# Altium project RC_Wheelchair.PrjPCB (part 2 of 4)

## Sheet Connector_Section.SchDoc
size A; DocumentNumber: 6; SheetNumber: 6; SheetTotal: 8
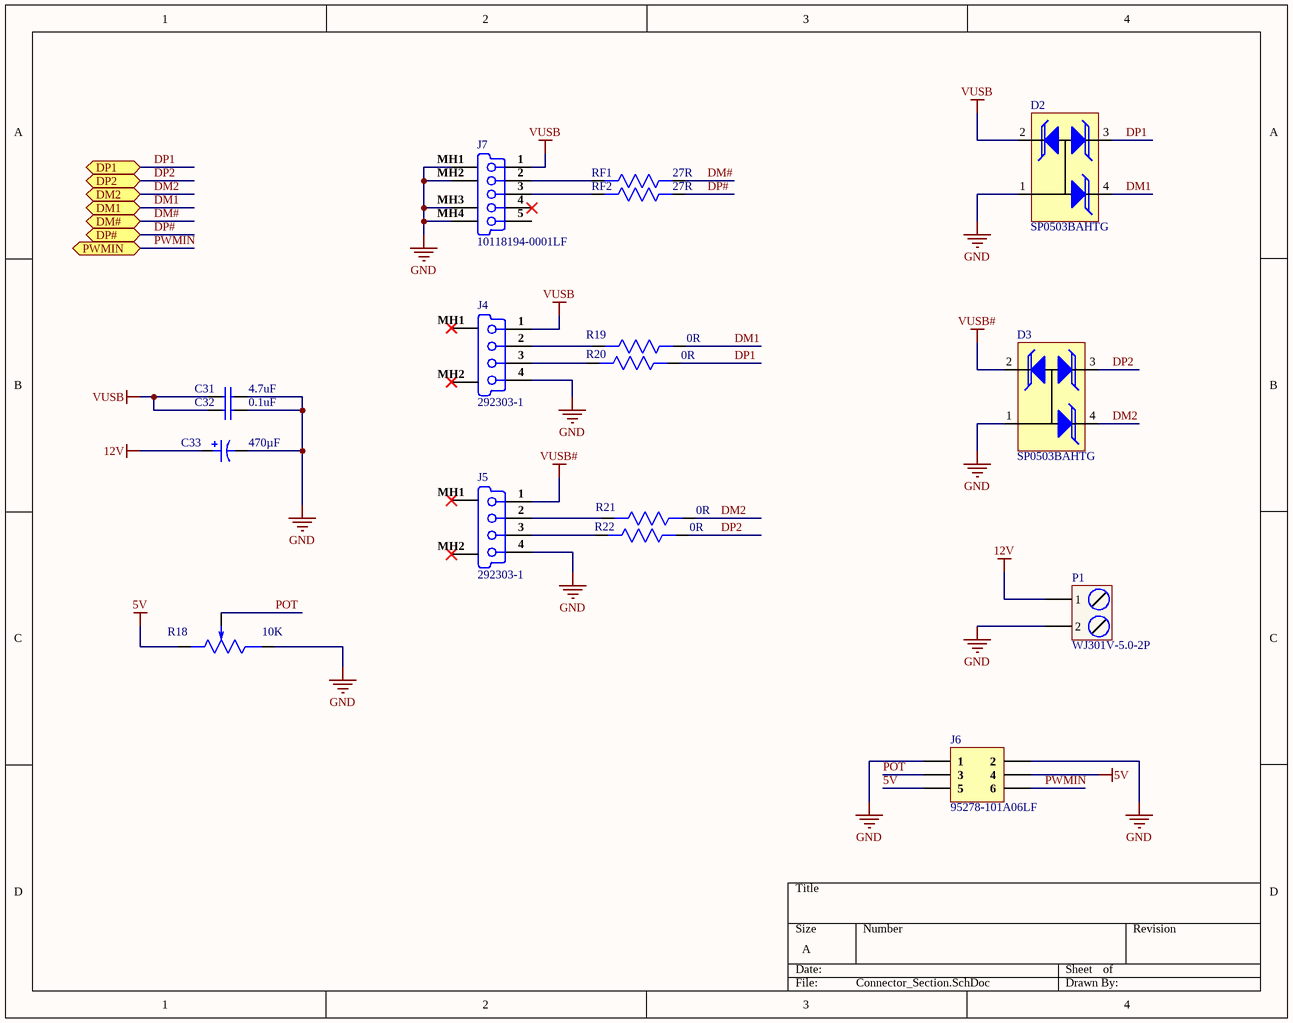
[diagram p3: Connector_Section.SchDoc]

### Parts
C31  4.7uF  [CAP 0603]
C32  0.1uF  [CAP 0402]
C33  470µF  [UCD1V471MNL6GS]
D2  SP0503BAHTG  [SOT-143]
D3  SP0503BAHTG  [SOT-143]
J4  292303-1  [292303-1]
J5  292303-1  [292303-1]
J6  95278-101A06LF  [95278-101A06LF]
J7  10118194-0001LF  [10118194-0001LF]
P1  WJ301V-5.0-2P  [WJ301V-5.0-2P]
R18  10K  [RK14J11R000J]
R19  0R  [Res0402]
R20  0R  [Res0402]
R21  0R  [Res0402]
R22  0R  [Res0402]
RF1  27R  [Res0402]
RF2  27R  [Res0402]

### Ports
DM1 (bidir), DM2 (bidir), DM# (bidir), DP1 (bidir), DP2 (bidir), DP# (bidir), PWMIN (bidir)

### Nets
5V: J6.4 J6.5 R18.1(ccw)
12V: C33.1 P1.1
GND: C31.2 C32.2 C33.2 D2.1(K) D3.1(K) J4.4(NC) J5.4(NC) J6.1 J6.2 J7.MH1(Tab) J7.MH2(Tab) J7.MH3(Tab) J7.MH4(Tab) P1.2 R18.3(cw)
VUSB: C31.1 C32.1 D2.2(A) J4.1(V_BUS_(5V)) J7.1(V_BUS_(5V))
VUSB#: D3.2(A) J5.1(V_BUS_(5V))
DM1: D2.4(A) R19.1 ; port DM1
DM2: D3.4(A) R21.1 ; port DM2
DM#: RF1.1 ; port DM#
DP1: D2.3(A) R20.1 ; port DP1
DP2: D3.3(A) R22.1 ; port DP2
DP#: RF2.1 ; port DP#
POT: J6.3 R18.2(wiper)
PWMIN: J6.6 ; port PWMIN
NetJ4_2: J4.2(D-) R19.2
NetJ4_3: J4.3(D+) R20.2
NetJ5_2: J5.2(D-) R21.2
NetJ5_3: J5.3(D+) R22.2
NetJ7_2: J7.2(D-) RF1.2
NetJ7_3: J7.3(D+) RF2.2

Not connected (* = marked no-connect by the designer): J4 MH1(Tab)* MH2(Tab)*; J5 MH1(Tab)* MH2(Tab)*; J7 4(NC)* 5(GND); R18 D1(cw) D2(cw) MH1(cw) MH2(cw) MP1(cw) MP2(cw)

### Library data of the parts
C31 = CC0603KRX5R7BB475: CAP CER 4.7UF 16V X5R 0603; Manufacturer: Yageo; Tolerance: 10%; Supplier 1: Digi-Key; Manufacturer Part Number: CC0603KRX5R7BB475; Stock 1: 1214; Pricing 1: 1=0.53, 10=0.371, 100=0.2446 (USD); Mount: Surface Mount; Case/Package: 0603; Weight: 7.1E-05oz; Case Code (Imperial): 0603; Case Code (Metric): 1608; Min Operating Temperature: -55°C; Max Operating Temperature: 85°C; Capacitance: 4.7uF; Voltage Rating: 16V; Voltage Rating (DC): 16V; Packaging: Tape and Reel; Dielectric: X5R; Termination: SMD/SMT; Composition: Ceramic; Length: 1.6mm; Height: 0.8mm; Width: 0.8mm; Thickness: 0.037inch; Depth: 0.8mm; Lead Free: Lead Free; Halogen Free: Halogen Free; ComponentLink1URL: http://www.mouser.com/ds/2/447/UPY-GPHC_X5R_4V-to-50V_25-1131599.pdf?src-supplier=Mouser; ComponentLink1Description: http://www.mouser.com/ds/2/447/UPY-GPHC_X5R_4V-to-50V_25-1131599.pdf?src-supplier=Mouser; ComponentLink2URL: http://www.yageo.com/documents/recent/UPY-GPHC_X5R_4V-to-50V_25.pdf?src-supplier=Digi-Key; ComponentLink2Description: http://www.yageo.com/documents/recent/UPY-GPHC_X5R_4V-to-50V_25.pdf?src-supplier=Digi-Key; ComponentLink3URL: http://components.arrow.com/part/dataview/0323_04166500?src-supplier=Arrow+Europe; ComponentLink3Description: http://components.arrow.com/part/dataview/0323_04166500?src-supplier=Arrow+Europe; Supplier Part Number 1: 311-1785-1-ND
C32 = CC0402KRX7R7BB104: CAP CER 0.1UF 16V X7R 0402; Manufacturer: Yageo; Tolerance: 10%; Capacitance: 100nF; Supplier 1: Digi-Key; Manufacturer Part Number: CC0402KRX7R7BB104; Stock 1: 9987374; Pricing 1: 1=0.1, 10=0.034, 100=0.015, 500=0.0107, 1000=0.00841, 2500=0.00764, 5000=0.00703 (USD); Mount: Surface Mount; Case/Package: 0402; Number of Pins: 2; Case Code (Metric): 1005; Case Code (Imperial): 0402; Min Operating Temperature: -55°C; Max Operating Temperature: 125°C; Dielectric: X7R; Voltage Rating: 16V; Voltage Rating (DC): 16V; Packaging: Tape and Reel; Package Quantity: 1; Termination: SMD/SMT; Composition: Ceramic; Voltage: 16V; Length: 1mm; Height: 0.5mm; Width: 0.02inch; Thickness: 0.022inch; Depth: 0.5mm; Radiation Hardening: No; REACH SVHC: No SVHC; Lead Free: Lead Free; Halogen Free: Halogen Free; ComponentLink1URL: http://www.yageo.com/documents/recent/UPY-GPHC_X7R_6.3V-to-50V_8.pdf?src-supplier=Avnet+Europe; ComponentLink1Description: http://www.yageo.com/documents/recent/UPY-GPHC_X7R_6.3V-to-50V_8.pdf?src-supplier=Avnet+Europe; ComponentLink2URL: http://www.yageo.com/documents/recent/UPY-GPHC_X7R_6.3V-to-50V_18.pdf?src-supplier=Digi-Key; ComponentLink2Description: http://www.yageo.com/documents/recent/UPY-GPHC_X7R_6.3V-to-50V_18.pdf?src-supplier=Digi-Key; ComponentLink3URL: http://www.yageo.com/documents/recent/UPY-GPHC_X7R_6.3V-to-50V_8.pdf?src-supplier=Avnet; ComponentLink3Description: http://www.yageo.com/documents/recent/UPY-GPHC_X7R_6.3V-to-50V_8.pdf?src-supplier=Avnet; ComponentLink4URL: http://www.yageo.com/documents/recent/UPY-GPHC_X7R_6.3V-to-50V_18.pdf?src-supplier=Mouser; ComponentLink4Description: http://www.yageo.com/documents/recent/UPY-GPHC_X7R_6.3V-to-50V_18.pdf?src-supplier=Mouser; ComponentLink5URL: http://www.farnell.com/datasheets/2167236.pdf?src-supplier=Element14; ComponentLink5Description: http://www.farnell.com/datasheets/2167236.pdf?src-supplier=Element14; ComponentLink6URL: http://www.farnell.com/datasheets/1489800.pdf?src-supplier=Element14; ComponentLink6Description: http://www.farnell.com/datasheets/1489800.pdf?src-supplier=Element14; Supplier Part Number 1: 311-1338-1-ND
C33 = UCD1V471MNL6GS: 470µF 35V Aluminum Electrolytic Capacitors Radial, Can - SMD; Manufacturer: Nichicon; Capacitance: 470uF; Tolerance: 20%; Ripple Current: 950mA; Leakage Current: 3uA; Supplier 1: Digi-Key; Manufacturer Part Number: UCD1V471MNL6GS; Stock 1: 2530; Pricing 1: 1=1.04, 10=0.789, 50=0.6556, 100=0.5646 (USD); Case/Package: Aluminum; Min Operating Temperature: -55°C; Max Operating Temperature: 105°C; Voltage Rating (DC): 35V; Packaging: Tape and Reel; Package Quantity: 400; Termination: SMD/SMT; Length: 13.5mm; ComponentLink1URL: http://www.mouser.com/ds/2/293/e-ucd-883803.pdf?src-supplier=Mouser; ComponentLink1Description: http://www.mouser.com/ds/2/293/e-ucd-883803.pdf?src-supplier=Mouser; ComponentLink2URL: http://nichicon-us.com/english/products/pdfs/e-ucd.pdf?src-supplier=Digi-Key; ComponentLink2Description: http://nichicon-us.com/english/products/pdfs/e-ucd.pdf?src-supplier=Digi-Key; Supplier Part Number 1: 493-14715-6-ND
D2 D3 = SP0503BAHTG: TVS DIODE 5.5V 8.5V SOT143-4; Manufacturer: Littelfuse; Element Configuration: Common Anode; Direction: Unidirectional; Capacitance: 30pF; Number of Channels: 3; Power Line Protection: No; Polarity: Bidirectional,Unidirectional; Max Power Dissipation: 225mW; ESD Protection: Yes; Max Reverse Leakage Current: 100nA; Voltage Rating (DC): 5V; Diode Type: Avalanche; Supplier 1: Digi-Key; Manufacturer Part Number: SP0503BAHTG; Stock 1: 86047; Pricing 1: 1=0.8, 10=0.703, 25=0.6604, 100=0.4793, 250=0.4622, 500=0.40044, 1000=0.3408 (USD); Mount: Surface Mount; Case/Package: SOT-143; Number of Pins: 4; Min Operating Temperature: -40°C; Max Operating Temperature: 85°C; Operating Supply Voltage: 5.5V; Packaging: Tape and Reel; Number of Unidirectional Channels: 3; Reverse Standoff Voltage: 5.5V; Clamping Voltage: 8.5V; Breakdown Voltage: 5.5V; Termination: SMD/SMT; Working Voltage: 5.5V; Peak Pulse Power: 225mW; Leakage Current: 100nA; Number of Elements: 3; Power Dissipation: 225mW; Composition: Zener; Length: 3.04mm; Height: 1.05mm; Width: 1.4mm; Depth: 1.4mm; Radiation Hardening: No; REACH SVHC: No SVHC; Lead Free: Lead Free; ComponentLink1URL: https://www.littelfuse.com/~/media/files/littelfuse/technical%20resources/documents/data%20sheets/sp05xxba.pdf?src-supplier=Digi-Key; ComponentLink1Description: https://www.littelfuse.com/~/media/files/littelfuse/technical%20resources/documents/data%20sheets/sp05xxba.pdf?src-supplier=Digi-Key; ComponentLink2URL: http://www.farnell.com/datasheets/1911798.pdf?src-supplier=Element14; ComponentLink2Description: http://www.farnell.com/datasheets/1911798.pdf?src-supplier=Element14; ComponentLink3URL: http://www.littelfuse.com/data/en/Data_Sheets/SP05xxBA.pdf?src-supplier=Future+Electronics; ComponentLink3Description: http://www.littelfuse.com/data/en/Data_Sheets/SP05xxBA.pdf?src-supplier=Future+Electronics; ComponentLink4URL: http://www.mouser.com/ds/2/240/Littelfuse_TVS_Diode_Array_SP05_Datasheet.pdf-777043.pdf?src-supplier=Mouser; ComponentLink4Description: http://www.mouser.com/ds/2/240/Littelfuse_TVS_Diode_Array_SP05_Datasheet.pdf-777043.pdf?src-supplier=Mouser; ComponentLink5URL: http://www.farnell.com/datasheets/526672.pdf?src-supplier=Element14; ComponentLink5Description: http://www.farnell.com/datasheets/526672.pdf?src-supplier=Element14; ComponentLink6URL: https://www.verical.com/server-webapp/html/getDatasheet?partID=116020&src-supplier=Verical; ComponentLink6Description: https://www.verical.com/server-webapp/html/getDatasheet?partID=116020&src-supplier=Verical; Supplier Part Number 1: F2715CT-ND
J4 J5 = 292303-1: USB-A (USB TYPE-A) USB 2.0 Receptacle Connector 4 Position Through Hole, Right Angle; Manufacturer: TE Connectivity; Plating: Bright,Tin; Number of Positions: 4; Number of Ports: 1; Plating Thickness: 0.76um; Contact Current Rating: 1A; Circuit Application: Signal; Connector System: Cable-to-Board; USB Standard: USB 2.0; Insulation Resistance: 1GR; Voltage Rating (AC): 30V; Pitch: 2.5mm; PCB Thickness: 0.062inch; Tail Length: 0.112inch; Approvals: UL; Supplier 1: Digi-Key; Manufacturer Part Number: 292303-1; Stock 1: 19088; Pricing 1: 1=1.49, 10=1.354, 25=1.2716, 50=1.2162, 100=1.161, 250=1.0504, 500=0.96748, 1000=0.82926, 2500=0.77398 (USD); Mount: Through Hole,Horizontal; Contact Plating: Gold; Housing Material: Thermoplastic; Housing Color: Black; Contact Material: Copper Alloy,Copper; Number of Terminals: 4; Color: Black; Min Operating Temperature: -67°C; Max Operating Temperature: 185°C; Packaging: Rail/Tube; Package Quantity: 30; Termination: Through Hole; Gender: Receptacle; Connector Type: Receptacle; Orientation: Right Angle; Number of Contacts: 4; Current Rating: 1A; Length: 14.63mm; Depth: 14mm; REACH SVHC: No SVHC; Flammability Rating: UL94 V-0; Halogen Free: Halogen Free; ComponentLink1URL: http://www.farnell.com/datasheets/1699414.pdf?src-supplier=Farnell; ComponentLink1Description: http://www.farnell.com/datasheets/1699414.pdf?src-supplier=Farnell; ComponentLink2URL: http://www.te.com/commerce/DocumentDelivery/DDEController?Action=showdoc&DocId=Data+Sheet%7F1-1773453-6%7F0908%7Fpdf%7FEnglish%7FENG_DS_1-1773453-6_0908.pdf&src-supplier=Avnet; ComponentLink2Description: http://www.te.com/commerce/DocumentDelivery/DDEController?Action=showdoc&DocId=Data+Sheet%7F1-1773453-6%7F0908%7Fpdf%7FEnglish%7FENG_DS_1-1773453-6_0908.pdf&src-supplier=Avnet; ComponentLink3URL: http://www.te.com/commerce/DocumentDelivery/DDEController?Action=showdoc&DocId=Data+Sheet1-1773453-60908pdfEnglishENG_DS_1-1773453-6_0908.pdf&src-supplier=Avnet+Asia; ComponentLink3Description: http://www.te.com/commerce/DocumentDelivery/DDEController?Action=showdoc&DocId=Data+Sheet1-1773453-60908pdfEnglishENG_DS_1-1773453-6_0908.pdf&src-supplier=Avnet+Asia; ComponentLink4URL: https://www.te.com/commerce/DocumentDelivery/DDEController?Action=srchrtrv&DocNm=292303&DocType=Customer+Drawing&DocLang=English&src-supplier=Digi-Key; ComponentLink4Description: https://www.te.com/commerce/DocumentDelivery/DDEController?Action=srchrtrv&DocNm=292303&DocType=Customer+Drawing&DocLang=English&src-supplier=Digi-Key; ComponentLink5URL: http://www.farnell.com/datasheets/1699414.pdf?src-supplier=Element14; ComponentLink5Description: http://www.farnell.com/datasheets/1699414.pdf?src-supplier=Element14; ComponentLink6URL: http://www.farnell.com/cad/1699210.pdf?src-supplier=Element14; ComponentLink6Description: http://www.farnell.com/cad/1699210.pdf?src-supplier=Element14; ComponentLink7URL: https://www.alliedelec.com/m/d/b8ff6cd1157c72c7c4c41b4704d2a2e6.pdf?src-supplier=Allied+Electronics; ComponentLink7Description: https://www.alliedelec.com/m/d/b8ff6cd1157c72c7c4c41b4704d2a2e6.pdf?src-supplier=Allied+Electronics; ComponentLink8URL: http://www.te.com/commerce/DocumentDelivery/DDEController?Action=showdoc&DocId=Data+Sheet%7F1-1773453-6%7F0908%7Fpdf%7FEnglish%7FENG_DS_1-1773453-6_0908.pdf&src-supplier=Avnet+Europe; ComponentLink8Description: http://www.te.com/commerce/DocumentDelivery/DDEController?Action=showdoc&DocId=Data+Sheet%7F1-1773453-6%7F0908%7Fpdf%7FEnglish%7FENG_DS_1-1773453-6_0908.pdf&src-supplier=Avnet+Europe; ComponentLink9URL: https://www.distrelec.biz/Web/Downloads/07/08/04270708.pdf?mime=application%2Fpdf&src-supplier=Distrelec; ComponentLink9Description: https://www.distrelec.biz/Web/Downloads/07/08/04270708.pdf?mime=application%2Fpdf&src-supplier=Distrelec; ComponentLink10URL: http://www.jameco.com/Jameco/Products/ProdDS/921651.pdf?src-supplier=Jameco; ComponentLink10Description: http://www.jameco.com/Jameco/Products/ProdDS/921651.pdf?src-supplier=Jameco; ComponentLink11URL: http://www.onlinecomponents.com/productFiles/mf-AMP/ddecontrolleractionsrchrtrvdocnm117734536doctypedsdoclan.pdf?src-supplier=Onlinecomponents.com; ComponentLink11Description: http://www.onlinecomponents.com/productFiles/mf-AMP/ddecontrolleractionsrchrtrvdocnm117734536doctypedsdoclan.pdf?src-supplier=Onlinecomponents.com; ComponentLink12URL: http://www.te.com/commerce/DocumentDelivery/DDEController?Action=showdoc&DocId=Customer+Drawing%7F292303%7FE7%7Fpdf%7FEnglish%7FENG_CD_292303_E7.pdf%7F292303-1&src-supplier=Future+Electronics; ComponentLink12Description: http://www.te.com/commerce/DocumentDelivery/DDEController?Action=showdoc&DocId=Customer+Drawing%7F292303%7FE7%7Fpdf%7FEnglish%7FENG_CD_292303_E7.pdf%7F292303-1&src-supplier=Future+Electronics; Supplier Part Number 1: A31726-ND
J6 = 95278-101A06LF: CONN HEADER SMD 6POS 2.54MM; Manufacturer: Amphenol FCI; Number of Contacts: 6; Current Rating: 3A; Voltage Rating: 1.5kV; Insulation Resistance: 5GR; Gender: Male; Connector Type: Male Pin; Row Spacing: 0.1inch; Supplier 1: Digi-Key; Manufacturer Part Number: 95278-101A06LF; Stock 1: 1838; Pricing 1: 1=1.12, 10=0.989, 100=0.8531 (USD); Mount: Surface Mount; Contact Plating: Gold,GXT; Color: Black; Contact Material: Bronze; Housing Color: Black; Material: Thermoplastic; Housing Material: Thermoplastic; Min Operating Temperature: -65°C; Max Operating Temperature: 125°C; Number of Rows: 2; Termination: Solder; Package Quantity: 350; Packaging: Tape and Reel; Contact Gender: Male; Number of Positions: 6; Max Voltage Rating (AC): 1.5kV; Orientation: Straight; Length: 7.62mm; Pitch: 2.54mm; Contact Mating Length: 0.232inch; Depth: 4.83mm; Radiation Hardening: No; REACH SVHC: No SVHC; Lead Free: Lead Free; Flammability Rating: UL94 V-0; ComponentLink1URL: https://cdn.amphenol-icc.com/media/wysiwyg/files/drawing/95278.pdf?src-supplier=Digi-Key; ComponentLink1Description: https://cdn.amphenol-icc.com/media/wysiwyg/files/drawing/95278.pdf?src-supplier=Digi-Key; ComponentLink2URL: http://www.farnell.com/datasheets/1918632.pdf?src-supplier=Element14; ComponentLink2Description: http://www.farnell.com/datasheets/1918632.pdf?src-supplier=Element14; ComponentLink3URL: http://www.farnell.com/datasheets/52707.pdf?src-supplier=Element14; ComponentLink3Description: http://www.farnell.com/datasheets/52707.pdf?src-supplier=Element14; Supplier Part Number 1: 609-3487-6-ND
J7 = 10118194-0001LF: USB - Micro B Female USB 2 5 SMD USB Connectors RoHS; Manufacturer: Amphenol FCI; Gender: Receptacle; Current Rating: 1.8A; Connector Type: USB,Receptacle; Number of Contacts: 5; Insulation Resistance: 1GR; Number of Ports: 1; Max Voltage Rating (AC): 100V; Pitch: 0.65mm; Supplier 1: Digi-Key; Manufacturer Part Number: 10118194-0001LF; Stock 1: 35943; Pricing 1: 1=0.43, 10=0.405, 25=0.3648, 50=0.3242, 100=0.3107, 250=0.28368, 500=0.27016 (USD); Mount: Surface Mount,Horizontal; Color: Black; Contact Material: Copper Alloy; Contact Plating: Gold; Number of Terminals: 5; Housing Material: Polymer; Min Operating Temperature: -55°C; Max Operating Temperature: 85°C; Package Quantity: 9600; Packaging: Tape and Reel; Termination: Solder; Orientation: Right Angle; Features: Shielded; Length: 8.05mm; Depth: 5mm; Radiation Hardening: No; Lead Free: Lead Free; Flammability Rating: UL94 V-0; ComponentLink1URL: http://www.amphenol-icc.com/media/wysiwyg/files/drawing/10118194.pdf?src-supplier=Digi-Key; ComponentLink1Description: http://www.amphenol-icc.com/media/wysiwyg/files/drawing/10118194.pdf?src-supplier=Digi-Key; ComponentLink2URL: https://cdn.amphenol-icc.com/media/wysiwyg/files/drawing/10118194.pdf?src-supplier=Mouser; ComponentLink2Description: https://cdn.amphenol-icc.com/media/wysiwyg/files/drawing/10118194.pdf?src-supplier=Mouser; ComponentLink3URL: https://cdn.amphenol-icc.com/media/wysiwyg/files/drawing/10118194.pdf?src-supplier=Verical; ComponentLink3Description: https://cdn.amphenol-icc.com/media/wysiwyg/files/drawing/10118194.pdf?src-supplier=Verical; Supplier Part Number 1: 609-4618-1-ND
P1 = WJ301V-5.0-2P: P=5.0mm Screw terminal RoHS; Manufacturer: Ningbo Kangnex Elec; Value: Custom; Manufacturer Part No: WJ301V-5.0-2P; Package: Custom
R18 = RK14J11R000J: 10K ±30% SMD Potentiometers & Variable Resistors RoHS; Manufacturer: Alps Electric; Resistance: 10kR; Power Rating: 30mW; Number of Gangs: 1; Supplier 1: Mouser; Manufacturer Part Number: RK14J11R000J; Stock 1: 245; Pricing 1: 1=1.09, 25=0.964, 50=0.902, 100=0.872, 500=0.81, 1000=0.789 (USD); Mount: Surface Mount; Min Operating Temperature: -25°C; Max Operating Temperature: 70°C; Tolerance: 30%; Type: Potentiometer; Packaging: Bulk; Taper: Linear; Termination: SMD/SMT; Number of Turns: 1; Composition: Potentiometer; Radiation Hardening: No; ComponentLink1URL: http://www.alps.com/prod/info/E/HTML/Potentiometer/RotaryPotentiometers/RKJ1/RKJ1_list.html?src-supplier=Avnet+Europe; ComponentLink1Description: http://www.alps.com/prod/info/E/HTML/Potentiometer/RotaryPotentiometers/RKJ1/RKJ1_list.html?src-supplier=Avnet+Europe; ComponentLink2URL: http://www.alps.com/products/WebObjects/catalog.woa/E/HTML/Potentiometer/RotaryPotentiometers/RKJ1/RKJ1_list.html?src-supplier=Avnet; ComponentLink2Description: http://www.alps.com/products/WebObjects/catalog.woa/E/HTML/Potentiometer/RotaryPotentiometers/RKJ1/RKJ1_list.html?src-supplier=Avnet; ComponentLink3URL: http://www.alps.com/WebObjects/catalog.woa/E/HTML/Potentiometer/RotaryPotentiometers/RKJ1/RK14J11R000J.html?src-supplier=Mouser; ComponentLink3Description: http://www.alps.com/WebObjects/catalog.woa/E/HTML/Potentiometer/RotaryPotentiometers/RKJ1/RK14J11R000J.html?src-supplier=Mouser; Supplier Part Number 1: 688-RK14J11R000J
R19-R22 = RC0402JR-070RL: RES SMD 0 OHM JUMPER 1/16W 0402; Manufacturer: Yageo; Manufacturer Part Number: RC0402FR-070RL; Resistance: 0mR; Tolerance: 1%; Power Rating: 62.5mW; Voltage Rating: 50V; Temperature Coefficient: 200ppm/°C; Supplier 1: Digi-Key; Stock 1: 3681314; Pricing 1: 1=0.1, 10=0.013, 25=0.0092, 50=0.0072, 100=0.0053, 250=0.004, 500=0.0032, 1000=0.00236, 5000=0.00169 (USD); Mount: Surface Mount; Case/Package: 0402; Contact Plating: Tin,Matte; Case Code (Imperial): 0402; Case Code (Metric): 1005; Min Operating Temperature: -55°C; Max Operating Temperature: 155°C; Composition: Thick Film; Packaging: Tape and Reel; Termination: SMD/SMT; Length: 1mm; Height: 0.35mm; Width: 0.5mm; Radiation Hardening: No; Lead Free: Lead Free; ComponentLink1URL: http://www.yageo.com/documents/recent/PYu-RC0402_51_RoHS_L_6.pdf?src-supplier=Avnet; ComponentLink1Description: http://www.yageo.com/documents/recent/PYu-RC0402_51_RoHS_L_6.pdf?src-supplier=Avnet; ComponentLink2URL: http://www.yageo.com/documents/recent/PYu-RC0402_51_RoHS_L_6_r.pdf?src-supplier=Future+Electronics; ComponentLink2Description: http://www.yageo.com/documents/recent/PYu-RC0402_51_RoHS_L_6_r.pdf?src-supplier=Future+Electronics; ComponentLink3URL: http://www.yageo.com/documents/recent/PYu-RC0402_51_RoHS_L_6.pdf?src-supplier=Avnet+Europe; ComponentLink3Description: http://www.yageo.com/documents/recent/PYu-RC0402_51_RoHS_L_6.pdf?src-supplier=Avnet+Europe; Supplier Part Number 1: 311-0.0LRCT-ND
RF1 RF2 = RT0402FRE0727RL: RES SMD 27 OHM 1% 1/16W 0402; Manufacturer: Yageo; Power Rating: 62.5mW; Voltage Rating: 50V; Max Power Dissipation: 63mW; Temperature Coefficient: 50ppm/°C; Supplier 1: Digi-Key; Manufacturer Part Number 1: RT0402FRE0727RL; Stock 1: 26946; Pricing 1: 1=0.1, 10=0.072, 100=0.0277, 1000=0.0122, 2500=0.0105, 5000=0.0094 (USD); Case/Package: 0402; Case Code (Metric): 1005; Case Code (Imperial): 0402; Min Operating Temperature: -55°C; Max Operating Temperature: 125°C; Resistance: 27R; Tolerance: 1%; Packaging: Tape and Reel; Package Quantity: 10000; Composition: Thin Film; Number of Terminations: 2; Termination: SMD/SMT; Military Standard: Not; Voltage Rating (DC): 50V; Features: Moisture Resistant; Length: 1mm; Height: 0.014inch; Width: 0.02inch; Depth: 0.5mm; Lead Free: Lead Free; ComponentLink1URL: http://www.yageo.com/NewPortal/yageodocoutput?fileName=/pdf/R-Chip/PYu-RT_1-to-0.05_RoHS_L_5.pdf&src-supplier=Digi-Key; ComponentLink1Description: http://www.yageo.com/NewPortal/yageodocoutput?fileName=/pdf/R-Chip/PYu-RT_1-to-0.05_RoHS_L_5.pdf&src-supplier=Digi-Key; ComponentLink2URL: http://www.mouser.com/ds/2/447/yageodocoutput-1125656.pdf?src-supplier=Mouser; ComponentLink2Description: http://www.mouser.com/ds/2/447/yageodocoutput-1125656.pdf?src-supplier=Mouser; Supplier Part Number 1: YAG3343CT-ND

## Sheet Controller Section.SchDoc
size A; DocumentNumber: 4; SheetNumber: 4; SheetTotal: 8
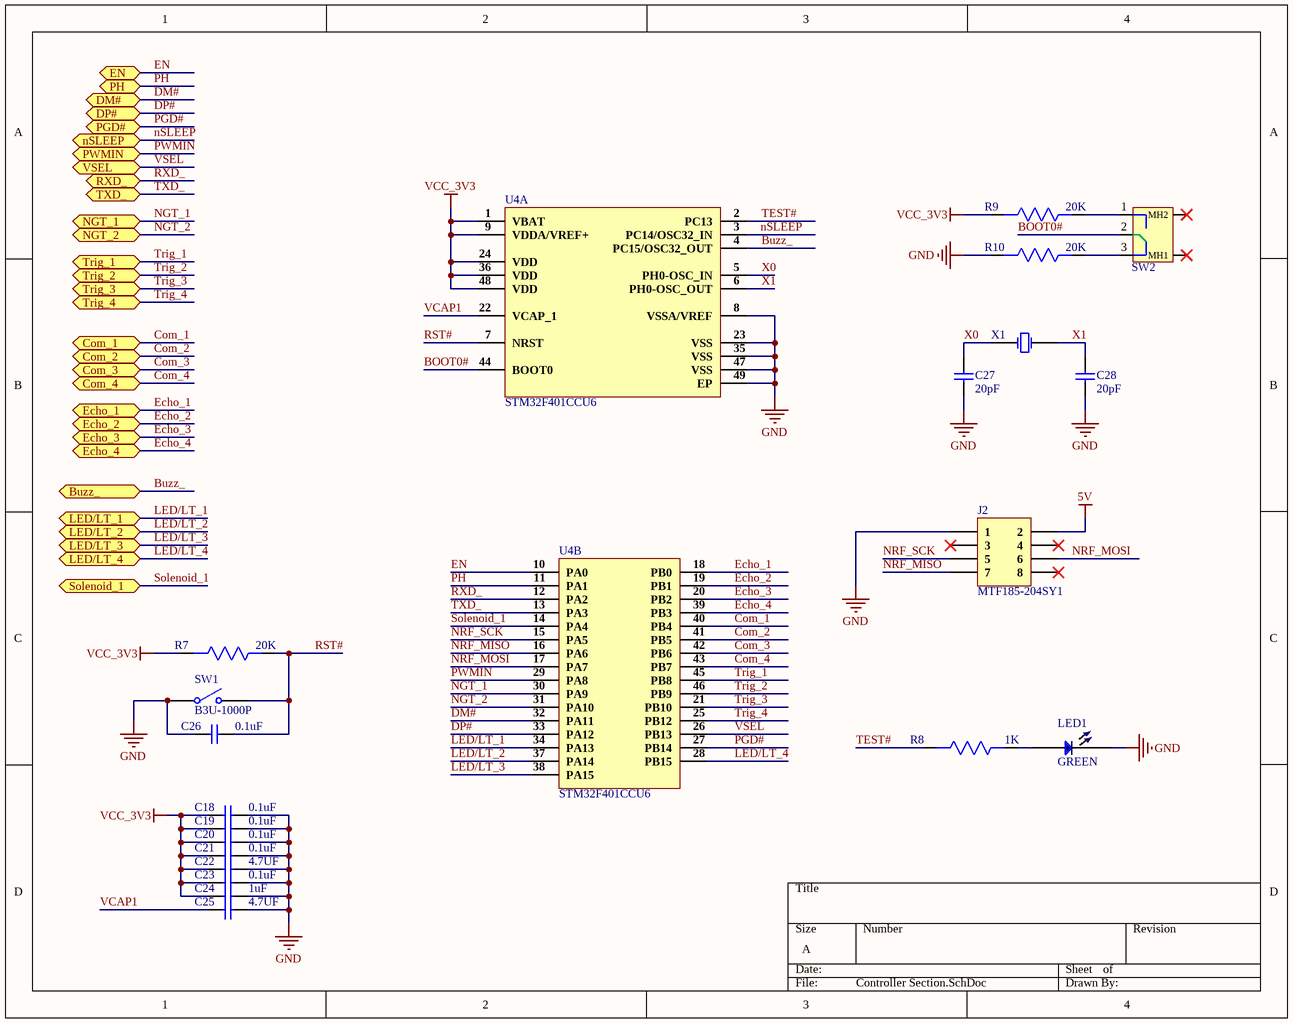
[diagram p4: Controller Section.SchDoc]

### Parts
C18  0.1uF  [Cap0402]
C19  0.1uF  [Cap0402]
C20  0.1uF  [Cap0402]
C21  0.1uF  [Cap0402]
C22  4.7UF  [Cap0603]
C23  0.1uF  [Cap0402]
C24  1uF  [Cap0402]
C25  4.7UF  [Cap0603]
C26  0.1uF  [Cap0402]
C27  20pF  [Cap 0201]
C28  20pF  [Cap 0201]
J2  MTF185-204SY1  [MTF185-204SY1]
LED1  GREEN  [LED 0603]
R7  20K  [Res0402]
R8  1K  [Res0402]
R9  20K  [Res0402]
R10  20K  [Res0402]
SW1  B3U-1000P  [B3U-1000P]
SW2  OS102011MA1QN1  [OS102011MA1QN1]  (value not drawn)
U4  STM32F401CCU6  [48-UFQFPN]  (parts A,B of 2)
X1  X1G004481000200  [X1G004481000200]  (value not drawn)

### Ports
Buzz_ (bidir), Com_1 (bidir), Com_2 (bidir), Com_3 (bidir), Com_4 (bidir), DM# (bidir), DP# (bidir), Echo_1 (bidir), Echo_2 (bidir), Echo_3 (bidir), Echo_4 (bidir), EN (bidir), LED/LT_1 (bidir), LED/LT_2 (bidir), LED/LT_3 (bidir), LED/LT_4 (bidir), NGT_1 (bidir), NGT_2 (bidir), nSLEEP (bidir), PGD# (bidir), PH (bidir), PWMIN (bidir), RXD_ (bidir), Solenoid_1 (bidir), Trig_1 (bidir), Trig_2 (bidir), Trig_3 (bidir), Trig_4 (bidir), TXD_ (bidir), VSEL (bidir)

### Nets
5V: J2.2
GND: C18.2 C19.2 C20.2 C21.2 C22.2 C23.2 C24.2 C25.2 C26.1 C27.1 C28.1 J2.1 LED1.2 R10.2 SW1.1 U4.8(VSSA/VREF) U4.23(VSS) U4.35(VSS) U4.47(VSS) U4.49(EP)
VCC_3V3: C18.1 C19.1 C20.1 C21.1 C22.1 C23.1 C24.1 R7.2 R9.2 U4.1(VBAT) U4.9(VDDA/VREF+) U4.24(VDD) U4.36(VDD) U4.48(VDD)
BOOT0#: SW2.2(+) U4.44(BOOT0)
Buzz_: U4.4(PC15/OSC32_OUT) ; port Buzz_
Com_1: U4.40(PB4) ; port Com_1
Com_2: U4.41(PB5) ; port Com_2
Com_3: U4.42(PB6) ; port Com_3
Com_4: U4.43(PB7) ; port Com_4
DM#: U4.32(PA11) ; port DM#
DP#: U4.33(PA12) ; port DP#
Echo_1: U4.18(PB0) ; port Echo_1
Echo_2: U4.19(PB1) ; port Echo_2
Echo_3: U4.20(PB2) ; port Echo_3
Echo_4: U4.39(PB3) ; port Echo_4
EN: U4.10(PA0) ; port EN
LED/LT_1: U4.34(PA13) ; port LED/LT_1
LED/LT_2: U4.37(PA14) ; port LED/LT_2
LED/LT_3: U4.38(PA15) ; port LED/LT_3
LED/LT_4: U4.28(PB15) ; port LED/LT_4
NGT_1: U4.30(PA9) ; port NGT_1
NGT_2: U4.31(PA10) ; port NGT_2
NRF_MISO: J2.7 U4.16(PA6)
NRF_MOSI: J2.6 U4.17(PA7)
NRF_SCK: J2.5 U4.15(PA5)
nSLEEP: U4.3(PC14/OSC32_IN) ; port nSLEEP
PGD#: U4.27(PB14) ; port PGD#
PH: U4.11(PA1) ; port PH
PWMIN: U4.29(PA8) ; port PWMIN
RST#: C26.2 R7.1 SW1.2 U4.7(NRST)
RXD_: U4.12(PA2) ; port RXD_
Solenoid_1: U4.14(PA4) ; port Solenoid_1
TEST#: R8.1 U4.2(PC13)
Trig_1: U4.45(PB8) ; port Trig_1
Trig_2: U4.46(PB9) ; port Trig_2
Trig_3: U4.21(PB10) ; port Trig_3
Trig_4: U4.25(PB12) ; port Trig_4
TXD_: U4.13(PA3) ; port TXD_
VCAP1: C25.1 U4.22(VCAP_1)
VSEL: U4.26(PB13) ; port VSEL
X0: C27.2 U4.5(PH0-OSC_IN) X1.1(OSC1)
X1: C28.2 U4.6(PH0-OSC_OUT) X1.2(OSC2)
NetLED1_1: LED1.1 R8.2
NetR9_1: R9.1 SW2.1(+)
NetR10_1: R10.1 SW2.3(+)

Not connected (* = marked no-connect by the designer): J2 3* 4* 8*; SW2 MH1* MH2*

### Library data of the parts
C18-C21 C23 C26 = CC0402KRX7R7BB104: as C32 on sheet Connector_Section; Supplier 1: Digi-Key; Manufacturer Part Number: CC0402KRX7R7BB104; Stock 1: 9987374; Pricing 1: 1=0.1, 10=0.034, 100=0.015, 500=0.0107, 1000=0.00841, 2500=0.00764, 5000=0.00703 (USD); Mount: Surface Mount; Case/Package: 0402; Number of Pins: 2; Case Code (Metric): 1005; Case Code (Imperial): 0402; Min Operating Temperature: -55°C; Max Operating Temperature: 125°C; Dielectric: X7R; Voltage Rating: 16V; Voltage Rating (DC): 16V; Packaging: Tape and Reel; Package Quantity: 1; Termination: SMD/SMT; Composition: Ceramic; Voltage: 16V; Length: 1mm; Height: 0.5mm; Width: 0.02inch; Thickness: 0.022inch; Depth: 0.5mm; Radiation Hardening: No; REACH SVHC: No SVHC; Lead Free: Lead Free; Halogen Free: Halogen Free; ComponentLink1URL: http://www.yageo.com/documents/recent/UPY-GPHC_X7R_6.3V-to-50V_8.pdf?src-supplier=Avnet+Europe; ComponentLink1Description: http://www.yageo.com/documents/recent/UPY-GPHC_X7R_6.3V-to-50V_8.pdf?src-supplier=Avnet+Europe; ComponentLink2URL: http://www.yageo.com/documents/recent/UPY-GPHC_X7R_6.3V-to-50V_18.pdf?src-supplier=Digi-Key; ComponentLink2Description: http://www.yageo.com/documents/recent/UPY-GPHC_X7R_6.3V-to-50V_18.pdf?src-supplier=Digi-Key; ComponentLink3URL: http://www.yageo.com/documents/recent/UPY-GPHC_X7R_6.3V-to-50V_8.pdf?src-supplier=Avnet; ComponentLink3Description: http://www.yageo.com/documents/recent/UPY-GPHC_X7R_6.3V-to-50V_8.pdf?src-supplier=Avnet; ComponentLink4URL: http://www.yageo.com/documents/recent/UPY-GPHC_X7R_6.3V-to-50V_18.pdf?src-supplier=Mouser; ComponentLink4Description: http://www.yageo.com/documents/recent/UPY-GPHC_X7R_6.3V-to-50V_18.pdf?src-supplier=Mouser; ComponentLink5URL: http://www.farnell.com/datasheets/2167236.pdf?src-supplier=Element14; ComponentLink5Description: http://www.farnell.com/datasheets/2167236.pdf?src-supplier=Element14; ComponentLink6URL: http://www.farnell.com/datasheets/1489800.pdf?src-supplier=Element14; ComponentLink6Description: http://www.farnell.com/datasheets/1489800.pdf?src-supplier=Element14; Supplier Part Number 1: 311-1338-1-ND
C22 C25 = CL10A475KA8NQNC: CAP CER 4.7UF 25V X5R 0603; Manufacturer: Samsung; Tolerance: 10%; Supplier 1: Digi-Key; Manufacturer Part Number: CL10A475KA8NQNC; Stock 1: 2252340; Pricing 1: 1=0.37, 10=0.255, 100=0.1528, 500=0.11456, 1000=0.09675 (USD); Mount: Surface Mount; Case/Package: 0603; Case Code (Metric): 1608; Case Code (Imperial): 0603; Contact Plating: Tin; Min Operating Temperature: -55°C; Max Operating Temperature: 85°C; Package Quantity: 1; Packaging: Tape and Reel; Capacitance: 4.7uF; Voltage Rating: 25V; Dielectric: X5R; Termination: Wraparound; Length: 1.6mm; Width: 0.031inch; Thickness: 0.035inch; Depth: 0.8mm; Lead Free: Lead Free; ComponentLink1URL: http://www.samsungsem.com/kr/support/product-search/mlcc/CL10A475KA8NQNC.jsp?src-supplier=Digi-Key; ComponentLink1Description: http://www.samsungsem.com/kr/support/product-search/mlcc/CL10A475KA8NQNC.jsp?src-supplier=Digi-Key; Supplier Part Number 1: 1276-1900-1-ND
C24 = GRM155R61E105KA12D: CAP CER 1UF 25V X5R 0402; Manufacturer: Murata; Material: Ceramic; Tolerance: 10%; Supplier 1: Digi-Key; Manufacturer Part Number: GRM155R61E105KA12D; Stock 1: 1150750; Pricing 1: 1=0.11, 10=0.077, 100=0.0363, 500=0.02546, 1000=0.02108, 2500=0.01962, 5000=0.01795 (USD); Mount: Surface Mount; Case/Package: 0402; Weight: 0.000212oz; Case Code (Metric): 1005; Case Code (Imperial): 0402; Min Operating Temperature: -55°C; Max Operating Temperature: 85°C; Capacitance: 1uF; Voltage Rating: 25V; Packaging: Tape and Reel; Dielectric: X5R; Voltage: 25V; Termination: SMD/SMT; Voltage Rating (DC): 25V; Package Quantity: 10000; Length: 1mm; Height: 0.5mm; Width: 0.5mm; Thickness: 0.022inch; Depth: 0.5mm; REACH SVHC: No SVHC; Lead Free: Lead Free; ComponentLink1URL: http://www.farnell.com/datasheets/2048341.pdf?src-supplier=Element14; ComponentLink1Description: http://www.farnell.com/datasheets/2048341.pdf?src-supplier=Element14; Supplier Part Number 1: 490-10017-6-ND
C27 C28 = GJM0336C1E200JB01D: CAP CER 20PF 25V C0H 0201; Manufacturer: Murata; Tolerance: 5%; Supplier 1: Digi-Key; Manufacturer Part Number: GJM0336C1E200JB01D; Stock 1: 13650; Pricing 1: 1=0.1, 10=0.074, 100=0.0329, 500=0.02348, 1000=0.01845, 2500=0.01678, 5000=0.01543 (USD); Mount: Surface Mount; Case/Package: 0201; Case Code (Metric): 0603; Case Code (Imperial): 0201; Min Operating Temperature: -55°C; Max Operating Temperature: 125°C; Capacitance: 20pF; Voltage Rating: 25V; Packaging: Tape and Reel; Termination: SMD/SMT; Voltage Rating (DC): 25V; Length: 0.024inch; Width: 0.012inch; Thickness: 0.013inch; Lead Free: Lead Free; ComponentLink1URL: http://www.mouser.com/ds/2/281/c02e-2905.pdf?src-supplier=Mouser; ComponentLink1Description: http://www.mouser.com/ds/2/281/c02e-2905.pdf?src-supplier=Mouser; ComponentLink2URL: http://search.murata.co.jp/Ceramy/image/img/A01X/partnumbering_e_01.pdf?src-supplier=Digi-Key; ComponentLink2Description: http://search.murata.co.jp/Ceramy/image/img/A01X/partnumbering_e_01.pdf?src-supplier=Digi-Key; Supplier Part Number 1: 490-13313-1-ND
J2 = MTF185-204SY1: Female Header Female Socket 0.100"(2.54mm) 8 2 Through Hole,P=2.54mm Pin Header & Female Header RoHS
LED1 = LTST-C190KGKT: LED GREEN CLEAR CHIP SMD; Manufacturer: Vishay Lite-On; Lens Color: Colorless; Lens Style: Diffused,Colorless,Rectangular,Clear; Forward Voltage: 2V; Luminous Intensity: 35mcd; Viewing Angle: 130°; Dominant Wavelength: 571nm; Test Current: 20mA; Wavelength: 574nm; Forward Current: 30mA; Power Rating: 75mW; Number of Elements: 1; Reverse Voltage: 5V; Supplier 1: Digi-Key; Manufacturer Part Number: LTST-C190KGKT; Stock 1: 1327387; Pricing 1: 1=0.26, 10=0.188, 25=0.138, 100=0.0987, 250=0.06712, 500=0.05922, 1000=0.04639 (USD); Mount: Surface Mount; Case/Package: 0603; Number of Pins: 2; Color: Green; Case Code (Metric): 1608; Case Code (Imperial): 0603; Min Operating Temperature: -55°C; Max Operating Temperature: 85°C; Packaging: Tape and Reel; Package Quantity: 1; Lens Transparency: Clear; Illumination Color: Green; Power Dissipation: 75mW; Number of LEDs: 1; Length: 1.6mm; Height: 0.8mm; Width: 0.8mm; Depth: 0.8mm; Radiation Hardening: No; Lead Free: Lead Free; ComponentLink1URL: https://www.verical.com/server-webapp/html/getDatasheet?partID=141494&src-supplier=Verical; ComponentLink1Description: https://www.verical.com/server-webapp/html/getDatasheet?partID=141494&src-supplier=Verical; ComponentLink2URL: http://optoelectronics.liteon.com/upload/download/DS22-2000-074/LTST-C190KGKT.PDF?src-supplier=Digi-Key; ComponentLink2Description: http://optoelectronics.liteon.com/upload/download/DS22-2000-074/LTST-C190KGKT.PDF?src-supplier=Digi-Key; ComponentLink3URL: http://www.mouser.com/ds/2/239/LTST-C190KGKT-1141861.pdf?src-supplier=Mouser; ComponentLink3Description: http://www.mouser.com/ds/2/239/LTST-C190KGKT-1141861.pdf?src-supplier=Mouser; ComponentLink4URL: http://uk.rs-online.com/webdocs/0dc0/0900766b80dc02a8.pdf?src-supplier=RSComponents; ComponentLink4Description: http://uk.rs-online.com/webdocs/0dc0/0900766b80dc02a8.pdf?src-supplier=RSComponents; Supplier Part Number 1: 160-1435-6-ND
R7 R9 R10 = RC0402JR-0720KL: RES SMD 20K OHM 1% 1/16W 0402; Manufacturer: Yageo; Resistance: 20kR; Power Rating: 62.5mW; Tolerance: 5%; Voltage Rating: 50V; Temperature Coefficient: 100ppm/°C; Max Power Dissipation: 63mW; ComponentLink1URL: https://industrial.panasonic.com/cdbs/www-data/pdf/RDA0000/AOA0000C301.pdf?src-supplier=Future+Electronics; ComponentLink1Description: https://industrial.panasonic.com/cdbs/www-data/pdf/RDA0000/AOA0000C301.pdf?src-supplier=Future+Electronics; ComponentLink2URL: http://www.jameco.com/Jameco/Products/ProdDS/1986781.pdf?src-supplier=Jameco; ComponentLink2Description: http://www.jameco.com/Jameco/Products/ProdDS/1986781.pdf?src-supplier=Jameco; ComponentLink3URL: http://www.farnell.com/datasheets/2059623.pdf?src-supplier=Farnell; ComponentLink3Description: http://www.farnell.com/datasheets/2059623.pdf?src-supplier=Farnell; ComponentLink4URL: http://industrial.panasonic.com/www-data/pdf/AOA0000/AOA0000CE1.pdf?src-supplier=Avnet; ComponentLink4Description: http://industrial.panasonic.com/www-data/pdf/AOA0000/AOA0000CE1.pdf?src-supplier=Avnet; ComponentLink5URL: http://www.alliedelec.com/m/d/51cd0790071e1666bdb9d00c57fcf960.pdf?src-supplier=Allied+Electronics; ComponentLink5Description: http://www.alliedelec.com/m/d/51cd0790071e1666bdb9d00c57fcf960.pdf?src-supplier=Allied+Electronics; ComponentLink6URL: http://industrial.panasonic.com/www-data/pdf/AOA0000/AOA0000CE1.pdf?src-supplier=Avnet+Europe; ComponentLink6Description: http://industrial.panasonic.com/www-data/pdf/AOA0000/AOA0000CE1.pdf?src-supplier=Avnet+Europe; ComponentLink7URL: http://www.farnell.com/datasheets/2059623.pdf?src-supplier=Element14; ComponentLink7Description: http://www.farnell.com/datasheets/2059623.pdf?src-supplier=Element14; ComponentLink8URL: http://industrial.panasonic.com/cdbs/www-data/pdf/RDA0000/AOA0000C301.pdf?src-supplier=Farnell; ComponentLink8Description: http://industrial.panasonic.com/cdbs/www-data/pdf/RDA0000/AOA0000C301.pdf?src-supplier=Farnell; ComponentLink9URL: http://industrial.panasonic.com/www-data/pdf/AOA0000/AOA0000CE1.pdf?src-supplier=Avnet+Asia; ComponentLink9Description: http://industrial.panasonic.com/www-data/pdf/AOA0000/AOA0000CE1.pdf?src-supplier=Avnet+Asia; ComponentLink10URL: http://www.yageo.com.tw/exep/pages/download/literatures/PYu-R_INT-thick_7.pdf?src-supplier=Digi-Key; ComponentLink10Description: http://www.yageo.com.tw/exep/pages/download/literatures/PYu-R_INT-thick_7.pdf?src-supplier=Digi-Key; ComponentLink11URL: http://www.yageo.com/NewPortal/yageodocoutput?fileName=/pdf/R-Chip/PYu-RC_51_RoHS_P_0.pdf&src-supplier=Digi-Key; ComponentLink11Description: http://www.yageo.com/NewPortal/yageodocoutput?fileName=/pdf/R-Chip/PYu-RC_51_RoHS_P_0.pdf&src-supplier=Digi-Key; ComponentLink12URL: http://www.yageo.com/documents/recent/PYu-RC0402_51_RoHS_L_6_r.pdf?src-supplier=Future+Electronics; ComponentLink12Description: http://www.yageo.com/documents/recent/PYu-RC0402_51_RoHS_L_6_r.pdf?src-supplier=Future+Electronics; ComponentLink13URL: http://www.mouser.com/ds/2/447/PYu-RC0402_51_RoHS_L_6_r-8721.pdf?src-supplier=Mouser; ComponentLink13Description: http://www.mouser.com/ds/2/447/PYu-RC0402_51_RoHS_L_6_r-8721.pdf?src-supplier=Mouser; ComponentLink14URL: http://www.yageo.com/documents/recent/PYu-RC0402_51_RoHS_L_6.pdf?src-supplier=Avnet+Europe; ComponentLink14Description: http://www.yageo.com/documents/recent/PYu-RC0402_51_RoHS_L_6.pdf?src-supplier=Avnet+Europe; Supplier 1: Digi-Key; Manufacturer Part Number: RC0402JR-0720KL; Stock 1: 4805429; Pricing 1: 1=0.1, 10=0.013, 100=0.0053, 1000=0.0024, 2500=0.0021, 5000=0.0017 (USD); Case/Package: 0402; Number of Pins: 2; Case Code (Metric): 1005; Case Code (Imperial): 0402; Min Operating Temperature: -55°C; Max Operating Temperature: 155°C; Package Quantity: 1; Packaging: Tape and Reel; Composition: Thick Film; Number of Terminations: 2; Termination: SMD/SMT; Military Standard: Not; Voltage Rating (DC): 50V; Features: Moisture Resistant; Length: 0.039inch; Height: 0.016inch; Width: 0.02inch; Depth: 0.5mm; REACH SVHC: No SVHC; Lead Free: Lead Free; ComponentLink15URL: http://www.yageo.com/documents/recent/PYu-RC_Group_51_RoHS_L_9.pdf?src-supplier=Digi-Key; ComponentLink15Description: http://www.yageo.com/documents/recent/PYu-RC_Group_51_RoHS_L_9.pdf?src-supplier=Digi-Key; ComponentLink16URL: http://www.farnell.com/datasheets/1018594.pdf?src-supplier=Element14; ComponentLink16Description: http://www.farnell.com/datasheets/1018594.pdf?src-supplier=Element14; Supplier Part Number 1: 311-20KJRCT-ND
R8 = RT0402FRE071KL: RES SMD 1K OHM 1% 1/16W 0402; Manufacturer: Yageo; Resistance: 1kR; Temperature Coefficient: 50ppm/°C; Power Rating: 62.5mW; Voltage Rating: 50V; Max Power Dissipation: 63mW; Supplier 1: Digi-Key; Manufacturer Part Number 1: RT0402FRE071KL; Stock 1: 228425; Pricing 1: 1=0.1, 10=0.072, 100=0.0277, 1000=0.0122, 2500=0.0105, 5000=0.0094 (USD); Case/Package: 0402; Contact Plating: Tin,Matte,Lead; Case Code (Metric): 1005; Case Code (Imperial): 0402; Min Operating Temperature: -55°C; Max Operating Temperature: 125°C; Tolerance: 1%; Composition: Thin Film; Package Quantity: 10000; Packaging: Tape and Reel; Number of Terminations: 2; Termination: SMD/SMT; Military Standard: Not; Voltage Rating (DC): 50V; Features: Moisture Resistant; Length: 1mm; Height: 0.014inch; Width: 0.02inch; Depth: 0.5mm; Radiation Hardening: No; Lead Free: Lead Free; ComponentLink1URL: http://www.mouser.com/ds/2/447/yageodocoutput-1125656.pdf?src-supplier=Mouser; ComponentLink1Description: http://www.mouser.com/ds/2/447/yageodocoutput-1125656.pdf?src-supplier=Mouser; ComponentLink2URL: http://www.yageo.com/documents/recent/PYu-RT_1-to-0.01_RoHS_L_9.pdf?src-supplier=Digi-Key; ComponentLink2Description: http://www.yageo.com/documents/recent/PYu-RT_1-to-0.01_RoHS_L_9.pdf?src-supplier=Digi-Key; Supplier Part Number 1: YAG1234CT-ND
SW1 = B3U-1000P: SWITCH TACTILE SPST-NO 0.05A 12V; Manufacturer: Omron; Mechanical Life: 200000Cycles; Operating Force: 1.5N; Throw Configuration: SPST; Current Rating: 50mA; Contact Resistance: 100mR; Illumination Type: Non-Illuminated,Illuminated; Switch Travel: 0.15mm; Switch Function: Off-Mom; Actuator Type: Standard; Actuator Length: 0.4mm; Ratings: Dust Proof,IP40; ComponentLink1URL: http://www.farnell.com/datasheets/60838.pdf?src-supplier=Farnell; ComponentLink1Description: http://www.farnell.com/datasheets/60838.pdf?src-supplier=Farnell; ComponentLink2URL: http://www.farnell.com/datasheets/60838.pdf?src-supplier=Element14; ComponentLink2Description: http://www.farnell.com/datasheets/60838.pdf?src-supplier=Element14; ComponentLink3URL: https://omronfs.omron.com/en_US/ecb/products/pdf/en-b3u.pdf?src-supplier=Digi-Key; ComponentLink3Description: https://omronfs.omron.com/en_US/ecb/products/pdf/en-b3u.pdf?src-supplier=Digi-Key; ComponentLink4URL: http://www.omron.com/ecb/products/pdf/en-b3u.pdf?src-supplier=Digi-Key; ComponentLink4Description: http://www.omron.com/ecb/products/pdf/en-b3u.pdf?src-supplier=Digi-Key; ComponentLink5URL: https://www.distrelec.biz/Web/Downloads/he/et/B3U_eng_datasheet.pdf?mime=application%2Fpdf&src-supplier=Distrelec; ComponentLink5Description: https://www.distrelec.biz/Web/Downloads/he/et/B3U_eng_datasheet.pdf?mime=application%2Fpdf&src-supplier=Distrelec; ComponentLink6URL: http://www.onlinecomponents.com/productFiles/mf-OM/en-b3u.pdf?src-supplier=Onlinecomponents.com; ComponentLink6Description: http://www.onlinecomponents.com/productFiles/mf-OM/en-b3u.pdf?src-supplier=Onlinecomponents.com; Supplier 1: Digi-Key; Manufacturer Part Number: B3U-1000P; Stock 1: 116454; Pricing 1: 1=1, 10=0.961, 25=0.9064, 50=0.7976, 100=0.7251, 250=0.68888, 500=0.67074, 1000=0.52571 (USD); Mount: Surface Mount; Weight: 0.000776oz; Contact Material: Silver; Min Operating Temperature: -25°C; Max Operating Temperature: 70°C; Packaging: Tape and Reel; Voltage Rating (DC): 12V; Package Quantity: 1; Max Current Rating: 50mA; Termination: SMD/SMT; Orientation: Straight; Max Voltage Rating (DC): 12V; Electrical Life: 200000Cycles; Insulation Resistance: 100MR; Contact Current Rating: 50mA; Length: 4mm; Height: 1.2mm; Depth: 2.5mm; Width: 3mm; REACH SVHC: Unknown; Lead Free: Lead Free; ComponentLink7URL: https://www.verical.com/server-webapp/html/getDatasheet?partID=552554&src-supplier=Verical; ComponentLink7Description: https://www.verical.com/server-webapp/html/getDatasheet?partID=552554&src-supplier=Verical; ComponentLink8URL: http://www.farnell.com/datasheets/1685550.pdf?src-supplier=Element14; ComponentLink8Description: http://www.farnell.com/datasheets/1685550.pdf?src-supplier=Element14; ComponentLink9URL: http://www.farnell.com/datasheets/2610940.pdf?src-supplier=Farnell; ComponentLink9Description: http://www.farnell.com/datasheets/2610940.pdf?src-supplier=Farnell; ComponentLink10URL: https://www.alliedelec.com/m/d/4c8a9ef82804fc3c241a13c1e298fd73.pdf?src-supplier=Allied+Electronics; ComponentLink10Description: https://www.alliedelec.com/m/d/4c8a9ef82804fc3c241a13c1e298fd73.pdf?src-supplier=Allied+Electronics; Supplier Part Number 1: SW1020DKR-ND
SW2 = OS102011MA1QN1: 2 Position SPDT Miniature Slide Switch 100MA 12V Through Hole, Right Angle; Manufacturer: ITT C&K; Mechanical Life: 10000Cycles; Body Material: Tin; Actuator Material: Polyoxymethylene,Acetal,Polyacetal; Contact Resistance: 20mR; Contact Style: Non-Shorting; Insulation Resistance: 100MR; Switch Travel: 2mm; Switch Function: On-On; Actuator Type: Standard; Actuator Length: 4mm; Supplier 1: Digi-Key; Manufacturer Part Number: OS102011MA1QN1; Stock 1: 24069; Pricing 1: 1=0.38, 10=0.363, 25=0.3552, 50=0.3176, 100=0.3024, 250=0.2948, 500=0.2495, 1000=0.2419, 5000=0.2117 (USD); Mount: Through Hole,Brackets,PCB; Contact Material: Copper Alloy,Brass,Silver; Contact Plating: Silver,Gold; Housing Material: Resin; Min Operating Temperature: -10°C; Max Operating Temperature: 70°C; Packaging: Bulk; Throw Configuration: SPDT; Voltage Rating (DC): 12V; Max Current Rating: 100mA; Contact Current Rating: 100mA; Max Voltage Rating (DC): 12V; Package Quantity: 300; Current Rating: 100mA; Termination: PC Pins; Electrical Life: 10000Cycles; Orientation: Right Angle; Length: 8.6mm; Width: 4.4mm; Depth: 8.4mm; Radiation Hardening: No; REACH SVHC: No SVHC; Lead Free: Lead Free; ComponentLink1URL: http://www.jameco.com/Jameco/Products/ProdDS/588220.pdf?src-supplier=Jameco; ComponentLink1Description: http://www.jameco.com/Jameco/Products/ProdDS/588220.pdf?src-supplier=Jameco; ComponentLink2URL: http://uk.rs-online.com/webdocs/1263/0900766b81263f61.pdf?src-supplier=RSComponents; ComponentLink2Description: http://uk.rs-online.com/webdocs/1263/0900766b81263f61.pdf?src-supplier=RSComponents; ComponentLink3URL: http://www.farnell.com/datasheets/1683358.pdf?src-supplier=Element14; ComponentLink3Description: http://www.farnell.com/datasheets/1683358.pdf?src-supplier=Element14; ComponentLink4URL: http://www1.futureelectronics.com/doc/C%20-%20K%20COMPONENTS/OS102011MA1QN1.pdf?src-supplier=Future+Electronics; ComponentLink4Description: http://www1.futureelectronics.com/doc/C%20-%20K%20COMPONENTS/OS102011MA1QN1.pdf?src-supplier=Future+Electronics; ComponentLink5URL: https://www.ckswitches.com/media/1428/os.pdf?src-supplier=Digi-Key; ComponentLink5Description: https://www.ckswitches.com/media/1428/os.pdf?src-supplier=Digi-Key; ComponentLink6URL: https://www.alliedelec.com/m/d/08271ccc8b1809c6b911a7d3c93f3e8a.pdf?src-supplier=Allied+Electronics; ComponentLink6Description: https://www.alliedelec.com/m/d/08271ccc8b1809c6b911a7d3c93f3e8a.pdf?src-supplier=Allied+Electronics; ComponentLink7URL: http://www.farnell.com/datasheets/2674787.pdf?src-supplier=Newark; ComponentLink7Description: http://www.farnell.com/datasheets/2674787.pdf?src-supplier=Newark; Supplier Part Number 1: CKN9559-ND
U4 = STM32F401CCU6: IC MCU 32BIT 256KB FLASH 48QFPN; Manufacturer: STMicroelectronics; RAM Size: 64KB; Max Power Dissipation: 625mW; Interface: I2C,SPI,USB,IrDA,SDIO,UART,USART,LIN,I2S; Number of I/Os: 36; Number of Timers/Counters: 8; Frequency: 84MHz; Max Supply Voltage: 3.6V; Min Supply Voltage: 1.8V; Oscillator Type: Internal; Data Bus Width: 32b; Number of USB Channels: 1; Number of SPI Channels: 7; Operating Supply Voltage: 3.3V; Number of I2C Channels: 3; Number of PWM Channels: 4; Watchdog Timer: Yes; Peripherals: Brown-out Detect/Reset,POR,PWM,WDT,DMA; Core Architecture: ARM; Supplier 1: Digi-Key; Manufacturer Part Number: STM32F401CCU6; Stock 1: 0; Pricing 1: 1=5.57, 10=4.998, 25=4.7252, 100=4.095, 250=3.885, 500=3.486, 1000=2.94, 2500=2.793, 5000=2.688 (USD); Case/Package: UFQFPN; Number of Pins: 48; Contact Plating: Tin,Matte; Min Operating Temperature: -40°C; Max Operating Temperature: 85°C; Package Quantity: 1560; Packaging: Tray; Number of Programmable I/O: 36; Max Frequency: 84MHz; Memory Type: FLASH; Memory Size: 256KB; Length: 7.1mm; Height: 0.55mm; Width: 7.1mm; Radiation Hardening: No; REACH SVHC: No SVHC; Lead Free: Lead Free; ComponentLink1URL: http://www.farnell.com/datasheets/1835718.pdf?src-supplier=Element14; ComponentLink1Description: http://www.farnell.com/datasheets/1835718.pdf?src-supplier=Element14; Supplier Part Number 1: 497-17426-ND
X1 = X1G004481000200: 24MHz ±100ppm 1.6V ~ 3.6V 3mA SMD-7050_4P SMD Oscillators(XO) RoHS